# Altium project Mega2560_Custom_v2.0.PrjPcb (part 1 of 4)
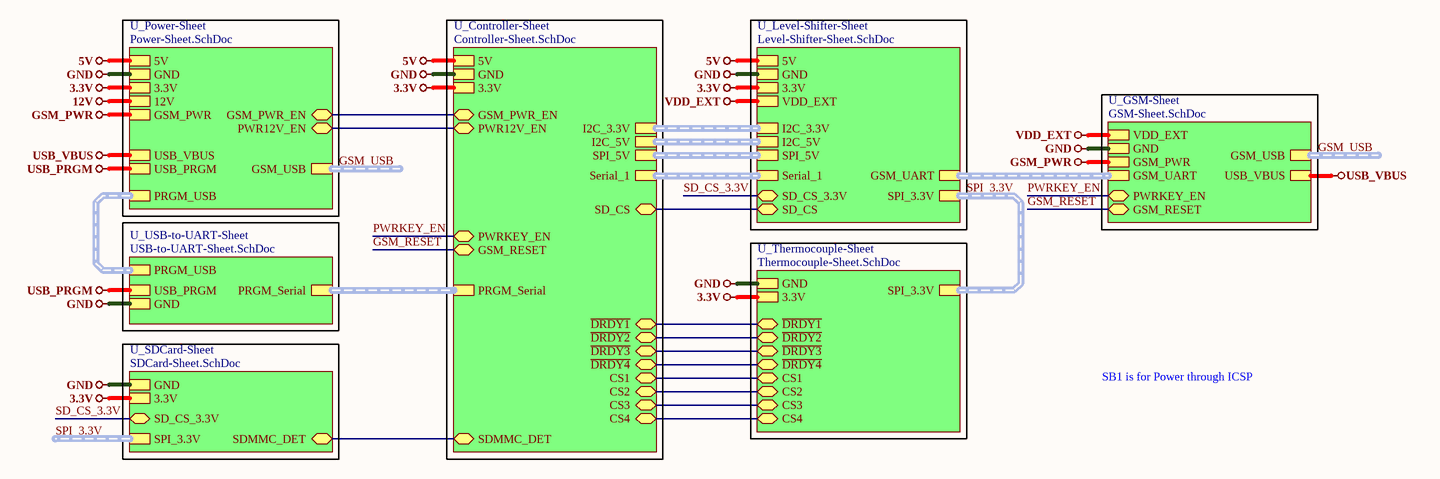
[diagram p0: Top-Sheet.SchDoc]
8 sheets, 213 parts. Net scope: hierarchical (ports join the sheet entries above them; power ports are global).
Board file: Mega2560_Custom.PcbDoc
Sheets:
  Top-Sheet.SchDoc
    U_Power-Sheet = Power-Sheet.SchDoc
    U_Thermocouple-Sheet = Thermocouple-Sheet.SchDoc
    U_Level-Shifter-Sheet = Level-Shifter-Sheet.SchDoc
    U_GSM-Sheet = GSM-Sheet.SchDoc
    U_USB-to-UART-Sheet = USB-to-UART-Sheet.SchDoc
    U_SDCard-Sheet = SDCard-Sheet.SchDoc
    U_Controller-Sheet = Controller-Sheet.SchDoc

## Sheet Top-Sheet.SchDoc
size A4; DocumentNumber: 1; SheetNumber: 1; SheetTotal: 8

### Sub-sheets
U_Controller-Sheet = Controller-Sheet.SchDoc: I2C_3.3V (harness I2C_3.3V), I2C_5V (harness I2C_5V), SPI_5V (harness SPI_5V), PRGM_Serial (harness PRGM_Serial), Serial_1 (harness Serial_1), ~{DRDY1} (bidir), ~{DRDY2} (bidir), ~{DRDY3} (bidir), ~{DRDY4} (bidir), CS1 (bidir), CS2 (bidir), CS3 (bidir), CS4 (bidir), PWRKEY_EN (bidir), GSM_RESET (bidir), SDMMC_DET (bidir), SD_CS (bidir), GSM_PWR_EN (bidir), PWR12V_EN (bidir), 5V, GND, 3.3V
U_GSM-Sheet = GSM-Sheet.SchDoc: GSM_UART (harness GSM_UART), GND, GSM_PWR, VDD_EXT, GSM_USB (harness GSM_USB), PWRKEY_EN (bidir), GSM_RESET (bidir), USB_VBUS
U_Level-Shifter-Sheet = Level-Shifter-Sheet.SchDoc: SPI_3.3V (harness SPI_3.3V), 5V, GND, 3.3V, VDD_EXT, I2C_3.3V (harness I2C_3.3V), I2C_5V (harness I2C_5V), SPI_5V (harness SPI_5V), Serial_1 (harness Serial_1), GSM_UART (harness GSM_UART), SD_CS_3.3V (bidir), SD_CS (bidir)
U_Power-Sheet = Power-Sheet.SchDoc: 5V, GND, 3.3V, 12V, GSM_USB (harness GSM_USB), PRGM_USB (harness PRGM_USB), GSM_PWR_EN (bidir), PWR12V_EN (bidir), GSM_PWR, USB_PRGM, USB_VBUS
U_SDCard-Sheet = SDCard-Sheet.SchDoc: SPI_3.3V (harness SPI_3.3V), GND, 3.3V, SD_CS_3.3V (bidir), SDMMC_DET (bidir)
U_Thermocouple-Sheet = Thermocouple-Sheet.SchDoc: GND, 3.3V, SPI_3.3V (harness Harness), ~{DRDY1} (bidir), ~{DRDY2} (bidir), ~{DRDY3} (bidir), ~{DRDY4} (bidir), CS1 (bidir), CS2 (bidir), CS3 (bidir), CS4 (bidir)
U_USB-to-UART-Sheet = USB-to-UART-Sheet.SchDoc: GND, USB_PRGM, PRGM_USB (harness PRGM_USB), PRGM_Serial (harness PRGM_Serial)

### Nets
3.3V: sheet U_Power-Sheet/3.3V, sheet U_Thermocouple-Sheet/3.3V, sheet U_Level-Shifter-Sheet/3.3V, sheet U_SDCard-Sheet/3.3V, sheet U_Controller-Sheet/3.3V
5V: sheet U_Power-Sheet/5V, sheet U_Level-Shifter-Sheet/5V, sheet U_Controller-Sheet/5V
GND: sheet U_Power-Sheet/GND, sheet U_Thermocouple-Sheet/GND, sheet U_Level-Shifter-Sheet/GND, sheet U_GSM-Sheet/GND, sheet U_USB-to-UART-Sheet/GND, sheet U_SDCard-Sheet/GND, sheet U_Controller-Sheet/GND
GSM_PWR: sheet U_Power-Sheet/GSM_PWR, sheet U_GSM-Sheet/GSM_PWR
USB_PRGM: sheet U_Power-Sheet/USB_PRGM, sheet U_USB-to-UART-Sheet/USB_PRGM
USB_VBUS: sheet U_Power-Sheet/USB_VBUS, sheet U_GSM-Sheet/USB_VBUS
VDD_EXT: sheet U_Level-Shifter-Sheet/VDD_EXT, sheet U_GSM-Sheet/VDD_EXT
CS1: sheet U_Thermocouple-Sheet/CS1, sheet U_Controller-Sheet/CS1
CS2: sheet U_Thermocouple-Sheet/CS2, sheet U_Controller-Sheet/CS2
CS3: sheet U_Thermocouple-Sheet/CS3, sheet U_Controller-Sheet/CS3
CS4: sheet U_Thermocouple-Sheet/CS4, sheet U_Controller-Sheet/CS4
~{DRDY1}: sheet U_Thermocouple-Sheet/~{DRDY1}, sheet U_Controller-Sheet/~{DRDY1}
~{DRDY2}: sheet U_Thermocouple-Sheet/~{DRDY2}, sheet U_Controller-Sheet/~{DRDY2}
~{DRDY3}: sheet U_Thermocouple-Sheet/~{DRDY3}, sheet U_Controller-Sheet/~{DRDY3}
~{DRDY4}: sheet U_Thermocouple-Sheet/~{DRDY4}, sheet U_Controller-Sheet/~{DRDY4}
GSM_PWR_EN: sheet U_Power-Sheet/GSM_PWR_EN, sheet U_Controller-Sheet/GSM_PWR_EN
GSM_RESET: sheet U_GSM-Sheet/GSM_RESET, sheet U_Controller-Sheet/GSM_RESET
PWR12V_EN: sheet U_Power-Sheet/PWR12V_EN, sheet U_Controller-Sheet/PWR12V_EN
PWRKEY_EN: sheet U_GSM-Sheet/PWRKEY_EN, sheet U_Controller-Sheet/PWRKEY_EN
SD_CS: sheet U_Level-Shifter-Sheet/SD_CS, sheet U_Controller-Sheet/SD_CS
SD_CS_3.3V: sheet U_Level-Shifter-Sheet/SD_CS_3.3V, sheet U_SDCard-Sheet/SD_CS_3.3V
SDMMC_DET: sheet U_SDCard-Sheet/SDMMC_DET, sheet U_Controller-Sheet/SDMMC_DET

### Buses and harness runs
harness GSM_USB = sheet U_GSM-Sheet/GSM_USB
harness GSM_USB = sheet U_Power-Sheet/GSM_USB
harness sheet U_Controller-Sheet/I2C_3.3V = sheet U_Level-Shifter-Sheet/I2C_3.3V
harness sheet U_Controller-Sheet/I2C_5V = sheet U_Level-Shifter-Sheet/I2C_5V
harness sheet U_Controller-Sheet/PRGM_Serial = sheet U_USB-to-UART-Sheet/PRGM_Serial
harness sheet U_Controller-Sheet/Serial_1 = sheet U_Level-Shifter-Sheet/Serial_1
harness sheet U_Controller-Sheet/SPI_5V = sheet U_Level-Shifter-Sheet/SPI_5V
harness sheet U_GSM-Sheet/GSM_UART = sheet U_Level-Shifter-Sheet/GSM_UART
harness sheet U_Power-Sheet/PRGM_USB = sheet U_USB-to-UART-Sheet/PRGM_USB
harness SPI_3.3V = sheet U_Level-Shifter-Sheet/SPI_3.3V = sheet U_Thermocouple-Sheet/SPI_3.3V
harness SPI_3.3V = sheet U_SDCard-Sheet/SPI_3.3V

### Notes on the sheet
- SB1 is for Power through ICSP
- File:
- Title:
- Date:
- Page
- Num:
- Total:
- Drawn By: Huzaifa Ali

## Sheet Power-Sheet.SchDoc
size A4; DocumentNumber: 2; SheetNumber: 2; SheetTotal: 8
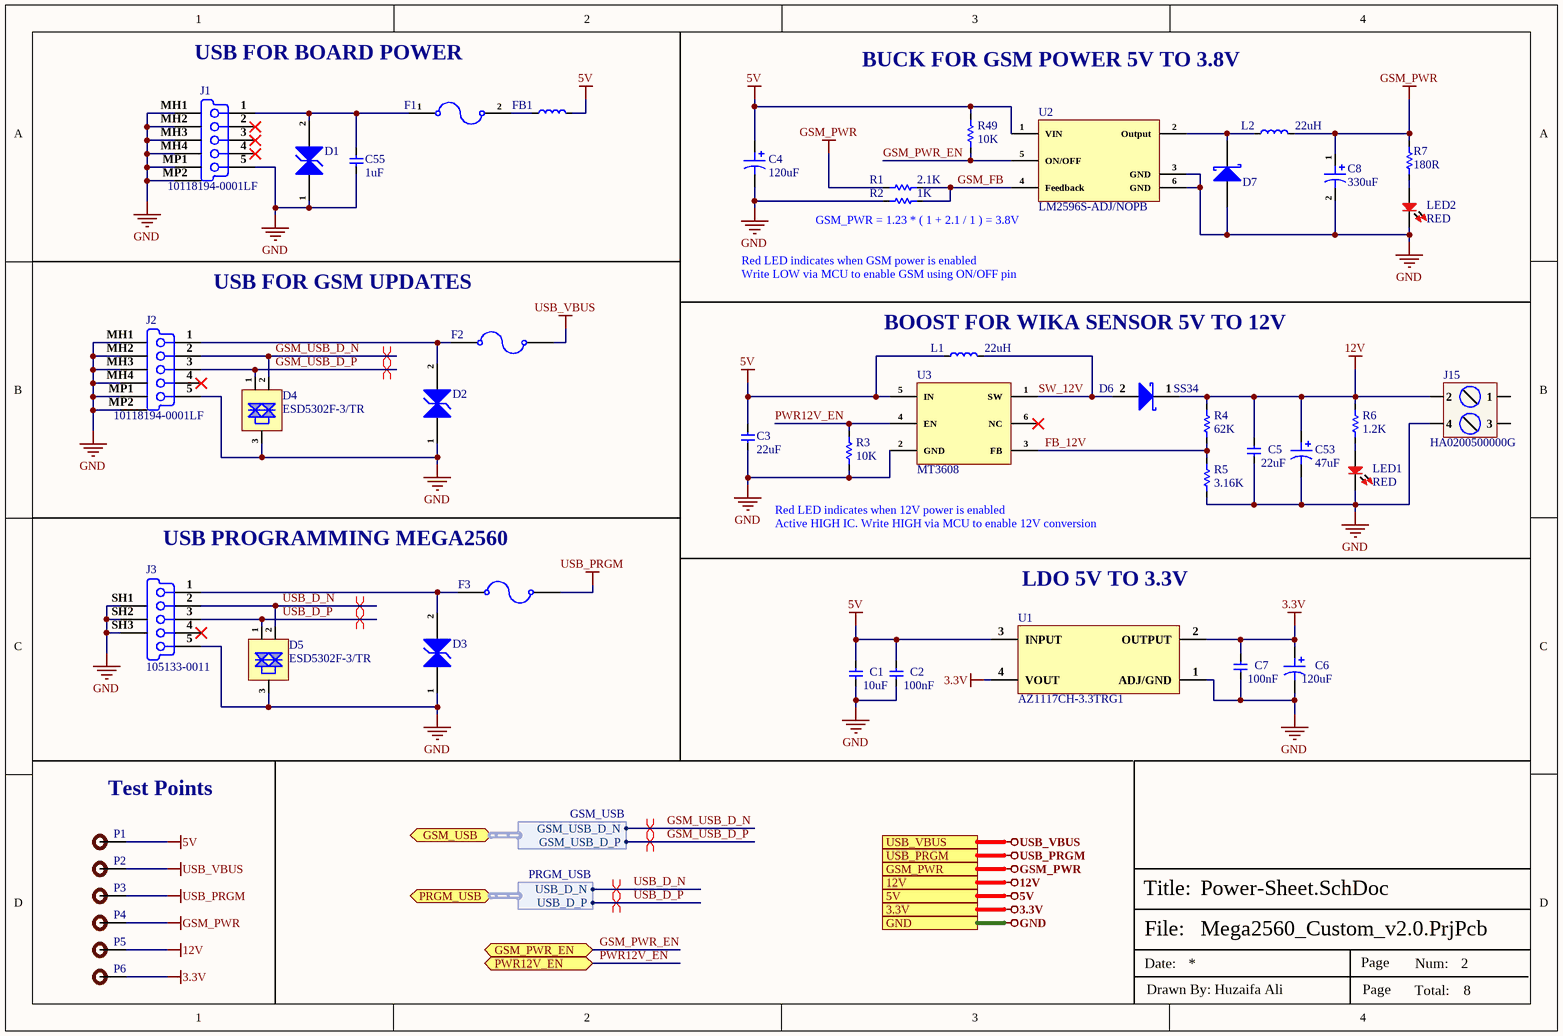
[diagram p1: Power-Sheet.SchDoc]

### Parts
C1  10uF  [Cap-0603]
C2  100nF  [Cap-0603]
C3  22uF  [Cap-0805]
C4  120uF  [20SVPF120M]
C5  22uF  [Cap-0805]
C6  120uF  [20SVPF120M]
C7  100nF  [Cap-0603]
C8  330uF  [Case-D]
C53  47uF  [25SVPF47M]
C55  1uF  [Cap-0603]
D1  PESD5V0H1BSFYL  [DSN0603-2]  (value not drawn)
D2  PESD5V0H1BSFYL  [DSN0603-2]  (value not drawn)
D3  PESD5V0H1BSFYL  [DSN0603-2]  (value not drawn)
D4  ESD5302F-3/TR  [Sot-23]
D5  ESD5302F-3/TR  [Sot-23]
D6  SS34  [SMA]
D7  SS32 /SMA(DO-214AC)  [SMA]  (value not drawn)
F1  1206L300SLTHYR  [Fuse 1206 (3216 Metric)]  (value not drawn)
F2  SMD0603-050  [Fuse-0603]  (value not drawn)
F3  SMD0603-050  [Fuse-0603]  (value not drawn)
FB1  100MHz  [IND-1206]  (value not drawn)
J1  10118194-0001LF  [10118194-0001LF_]
J2  10118194-0001LF  [10118194-0001LF_]
J3  105133-0011  [1051330011]
J15  HA0200500000G  [HA0200500000G]
L1  22uH  [SMRH74-220MT]
L2  22uH  [SSL0804T-220M-N]
LED1  RED  [LED-0603]
LED2  RED  [LED-0603]
P1  TEST POINT  [Test-point]  (value not drawn)
P2  TEST POINT  [Test-point]  (value not drawn)
P3  TEST POINT  [Test-point]  (value not drawn)
P4  TEST POINT  [Test-point]  (value not drawn)
P5  TEST POINT  [Test-point]  (value not drawn)
P6  TEST POINT  [Test-point]  (value not drawn)
R1  2.1K  [Res-0603]
R2  1K  [Res-0603]
R3  10K  [Res-0603]
R4  62K  [Res-0603]
R5  3.16K  [Res-0603]
R6  1.2K  [Res-0603]
R7  180R  [Res-0603]
R49  10K  [Res-0603]
U1  AZ1117CH-3.3TRG1  [SOT- 223]
U2  LM2596S-ADJ/NOPB  [DDPAK]
U3  MT3608  [SOT-23-6]

### Ports
3.3V, 5V, 12V, GND, GSM_PWR, GSM_PWR_EN (bidir), GSM_USB (bidir, harness GSM_USB), PRGM_USB (bidir, harness PRGM_USB), PWR12V_EN (bidir), USB_PRGM, USB_VBUS

### Harnesses
GSM_USB: GSM_USB_D_N, GSM_USB_D_P
PRGM_USB: USB_D_N, USB_D_P

### Nets
3.3V: C6.1 C7.2 P6.1 U1.2(OUTPUT) U1.4(VOUT) ; port 3.3V
5V: C1.2 C2.2 C3.2 C4.1 FB1.2 L1.1 P1.1 R49.2 U1.3(INPUT) U2.1(VIN) U3.5(IN) ; port 5V
12V: C5.2 C53.1 D6.1(K) J15.2 P5.1 R4.2 R6.2 ; port 12V
GND: C1.1 C2.1 C3.1 C4.2 C5.1 C6.2 C7.1 C8.2 C53.2 C55.1 D1.1 D2.1 D3.1 D4.3(GND) D5.3(GND) D7.2(A) J1.5(GND) J1.MH1(Tab) J1.MH2(Tab) J1.MH3(Tab) J1.MH4(Tab) J1.MP1(Tab) J1.MP2(Tab) J2.5(GND) J2.MH1(Tab) J2.MH2(Tab) J2.MH3(Tab) J2.MH4(Tab) J2.MP1(Tab) J2.MP2(Tab) J3.5(GND) J3.SH1 J3.SH2 J3.SH3 J15.4 LED1.2 LED2.2 R2.1 R3.1 R5.1 U1.1(ADJ/GND) U2.3(GND) U2.6(GND) U3.2(GND) ; port GND
GSM_PWR: C8.1 L2.2 P4.1 R1.1 R7.2 ; port GSM_PWR
USB_PRGM: F3.2 P3.1 ; port USB_PRGM
USB_VBUS: F2.2 P2.1 ; port USB_VBUS
FB_12V: R4.1 R5.2 U3.3(FB)
GSM_FB: R1.2 R2.2 U2.4(Feedback)
GSM_PWR_EN: R49.1 U2.5(ON/OFF) ; port GSM_PWR_EN
GSM_USB_D_N: D4.2(I/O2) J2.2(D-) ; port GSM_USB.GSM_USB_D_N  [project net GSM_USB.GSM_USB_D_N]
GSM_USB_D_P: D4.1(I/O1) J2.3(D+) ; port GSM_USB.GSM_USB_D_P  [project net GSM_USB.GSM_USB_D_P]
PWR12V_EN: R3.2 U3.4(EN) ; port PWR12V_EN
SW_12V: D6.2(A) L1.2 U3.1(SW)
USB_D_N: D5.2(I/O2) J3.2(D-) ; port PRGM_USB.USB_D_N
USB_D_P: D5.1(I/O1) J3.3(D+) ; port PRGM_USB.USB_D_P
NetC55_2: C55.2 D1.2 F1.1 J1.1(V_BUS_(5V))
NetD2_2: D2.2 F2.1 J2.1(V_BUS_(5V))
NetD3_2: D3.2 F3.1 J3.1(V_BUS_(5V))
NetD7_1: D7.1(K) L2.1 U2.2(Output)
NetF1_2: F1.2 FB1.1
NetLED1_1: LED1.1 R6.1
NetLED2_1: LED2.1 R7.1

Not connected (* = marked no-connect by the designer): J1 2(D-)* 3(D+)* 4(NC)*; J2 4(NC)*; J3 4(ID)*; J15 1 3; U3 6(NC)*

### Layout directives
differential pair: USB_D_N, USB_D_P
differential pair; net class USB; differential pair class USB_Lines; rule Impedance Constraint [Min = 85.00    Max = 90.00    ]; rule Matched Net Lengths [Tolerance = 50mil]: USB_D_N, USB_D_P
differential pair; net class GSM_USB; differential pair class GSM_USB_Lines; rule Impedance Constraint [Min = 85.00    Max = 90.00    ]; rule Matched Net Lengths [Tolerance = 50mil]: GSM_USB.GSM_USB_D_N, GSM_USB.GSM_USB_D_P

### Notes on the sheet
- USB FOR BOARD POWER
- BUCK FOR GSM POWER 5V TO 3.8V
- (near R2) GSM_PWR = 1.23 * ( 1 + 2.1 / 1 ) = 3.8V
- USB FOR GSM UPDATES
- Red LED indicates when GSM power is enabled
- Write LOW via MCU to enable GSM using ON/OFF pin
- (near L1) BOOST FOR WIKA SENSOR 5V TO 12V
- Red LED indicates when 12V power is enabled
- USB PROGRAMMING MEGA2560
- Active HIGH IC. Write HIGH via MCU to enable 12V conversion
- (near U1) LDO 5V TO 3.3V
- (near P1) Test Points
- File:
- Title:
- Date:
- Page
- Num:
- Total:
- Drawn By: Huzaifa Ali

### Library data of the parts
C1 = CC0603KRX5R7BB106: CAP CER 10UF 16V X5R 0603; Manufacturer: Yageo; Tolerance: 10%; Item Type: Capacitor; Supplier 1: Digi-Key; Manufacturer Part Number: CC0603KRX5R7BB106; RoHS: Yes; Category: Ceramic Capacitors; Stock 1: 240725; Pricing 1: 1=0.68000, 10=0.48000, 50=0.36300, 100=0.31610, 500=0.23416, 1000=0.19903 (USD); Mount: Surface Mount; Case/Package: 0603; Case Code (Imperial): 0603; Case Code (Metric): 1608; Min Operating Temperature: -55°C; Max Operating Temperature: 85°C; Packaging: Cut Tape; Capacitance: 10uF; Voltage Rating: 16V; RoHS Compliant: Yes; ComponentLink1URL: http://www.yageo.com/documents/recent/UPY-GPHC_X5R_4V-to-50V_25.pdf?src-supplier=Digi-Key; ComponentLink1Description: http://www.yageo.com/documents/recent/UPY-GPHC_X5R_4V-to-50V_25.pdf?src-supplier=Digi-Key; Supplier Part Number 1: 311-3486-1-ND; LCSC Part Number: C2936601
C2 C7 = CC0603KRX5R9BB104: CAP CER 0.1UF 50V X5R 0603; Manufacturer: Yageo; Tolerance: 10%; Item Type: Capacitor; Supplier 1: Digi-Key; Manufacturer Part Number: CC0603KRX5R9BB104; RoHS: Yes; Category: Ceramic Capacitors; Stock 1: 152253; Pricing 1: 1=0.10000, 10=0.05200, 50=0.02820, 100=0.02310, 500=0.01648, 1000=0.01294 (USD); Mount: Surface Mount; Case/Package: 0603; Case Code (Imperial): 0603; Case Code (Metric): 1608; Weight: 7.1E-05oz; Min Operating Temperature: -55°C; Max Operating Temperature: 85°C; Capacitance: 100nF; Packaging: Tape and Reel; Voltage Rating: 50V; Dielectric: X5R; Termination: SMD/SMT; Voltage Rating (DC): 50V; Package Quantity: 4000; Length: 0.063inch; Width: 0.031inch; Thickness: 0.035inch; Lead Free: Lead Free; Halogen Free: Halogen Free; ComponentLink1URL: http://www.mouser.com/ds/2/447/Yageo_UPY-GP_NP0_16V-to-50V_9-358835.pdf?src-supplier=Mouser; ComponentLink1Description: http://www.mouser.com/ds/2/447/Yageo_UPY-GP_NP0_16V-to-50V_9-358835.pdf?src-supplier=Mouser; ComponentLink2URL: https://www.yageo.com/upload/media/product/productsearch/datasheet/mlcc/UPY-GPHC_X5R_4V-to-50V_26.pdf?src-supplier=Digi-Key; ComponentLink2Description: https://www.yageo.com/upload/media/product/productsearch/datasheet/mlcc/UPY-GPHC_X5R_4V-to-50V_26.pdf?src-supplier=Digi-Key; ComponentLink3URL: http://www.yageo.com/exep/pages/download/literatures/ProductSelectionGuide%202014_Final_2.pdf?src-supplier=Digi-Key; ComponentLink3Description: http://www.yageo.com/exep/pages/download/literatures/ProductSelectionGuide%202014_Final_2.pdf?src-supplier=Digi-Key; Supplier Part Number 1: 311-4046-1-ND; LCSC Part Number: C110022
C3 C5 = CS2012X5R226M250NRE: 25V 22uF X5R ±20% 0805 Multilayer Ceramic Capacitors MLCC - SMD/SMT ROHS; Manufacturer: Samwha; Manufacturer Part Number: CS2012X5R226M250NRE; Package: 0805; LCSC Part Number: C513764; Item Type: Capacitor; ComponentLink1Description: LCSC; ComponentLink1URL: https://www.lcsc.com/product-detail/Multilayer-Ceramic-Capacitors-MLCC-SMD-SMT_Samwha-span-style-background-color-ff0-Capacitor-span-CS2012X5R226M250NRE_C513764.html
C4 C6 = 20SVPF120M: CAP ALUM POLY 120UF 20% 20V SMD; Manufacturer: Panasonic; Material: Polymer; ESR (Equivalent Series Resistance): 25mR; Ripple Current: 3.2A; Leakage Current: 480uA; Polarity: Polar; Life (Hours): 5000Hour; Dissipation Factor: 12%; Item Type: Capacitor; Supplier 1: Digi-Key; Manufacturer Part Number: 20SVPF120M; RoHS: Yes; Category: Aluminum Electrolytic Capacitors; Stock 1: 50150; Pricing 1: 1=1.45000, 10=1.14300, 50=0.99020, 100=0.85700, 500=0.64748 (USD); Mount: Surface Mount; Case/Package: Radial; Number of Pins: 6; Min Operating Temperature: -55°C; Max Operating Temperature: 105°C; Capacitance: 120uF; Tolerance: 20%; Voltage Rating: 20V; Packaging: Tape and Reel; Voltage Rating (DC): 20V; Package Quantity: 1000; Ripple Current (AC): 3.2A; Termination: SMD/SMT; Voltage: 20V; Series: OS-CON™, SVPF; Construction: Cylindrical; Diameter: 6.3mm; Length: 5.9mm; Height: 5.9mm; Height - Seated (Max): 0.236inch; Radiation Hardening: No; Reach SVHC Compliant: Yes; Lead Free: Lead Free; RoHS Compliant: Yes; ComponentLink1URL: https://datasheet.ciiva.com/24432/svpf-series-datasheet-24432811.pdf?src-supplier=Onlinecomponents.com; ComponentLink1Description: https://datasheet.ciiva.com/24432/svpf-series-datasheet-24432811.pdf?src-supplier=Onlinecomponents.com; ComponentLink2URL: https://datasheet.ciiva.com/25746/1734360-25746680.pdf?src-supplier=Farnell; ComponentLink2Description: https://datasheet.ciiva.com/25746/1734360-25746680.pdf?src-supplier=Farnell; ComponentLink3URL: https://datasheet.ciiva.com/22746/1734360-22746206.pdf?src-supplier=Element14; ComponentLink3Description: https://datasheet.ciiva.com/22746/1734360-22746206.pdf?src-supplier=Element14; ComponentLink4URL: https://datasheet.ciiva.com/46650/70324301-46650876.pdf?src-supplier=Allied+Electronics; ComponentLink4Description: https://datasheet.ciiva.com/46650/70324301-46650876.pdf?src-supplier=Allied+Electronics; Supplier Part Number 1: P16498CT-ND; LCSC Part Number: C186713
C8 = 6TPB330ML: CAP TANT POLY 330UF 6.3V 2917; Manufacturer: Panasonic; Tolerance: 20%; Leakage Current: 207.9uA; Polarity: Polar; ESR (Equivalent Series Resistance): 40mR; Ripple Current: 2A; Dissipation Factor: 10%; Item Type: Capacitor; Supplier 1: Arrow Electronics; Manufacturer Part Number: 6TPB330ML; RoHS: Yes; Category: Polymer Capacitors; Stock 1: 6258; Pricing 1: 1=2.17610, 10=1.72910, 25=1.72430, 100=1.31060, 250=1.29750, 500=0.96850, 1000=0.83640, 3000=0.77310, 6000=0.74930 (USD); Mount: Surface Mount; Case/Package: 2917; Case Code (Metric): 7343; Case Code (Imperial): 2917; Min Operating Temperature: -55°C; Max Operating Temperature: 105°C; Package Quantity: 2500; Packaging: Tape and Reel; Capacitance: 330uF; Voltage Rating: 6.3V; Voltage Rating (DC): 6.3V; Termination: SMD/SMT; Voltage: 6.3V; Features: General Purpose; Series: POSCAP™ TPB; Construction: Flat; Length: 7.3mm; Width: 4.3mm; Height: 2.8mm; Height - Seated (Max): 0.118inch; Depth: 4.3mm; Radiation Hardening: No; Reach SVHC Compliant: Yes; Lead Free: Lead Free; RoHS Compliant: Yes; ComponentLink1URL: https://datasheet.ciiva.com/48675/aaa8000ce6-48675081.pdf?src-supplier=Avnet; ComponentLink1Description: https://datasheet.ciiva.com/48675/aaa8000ce6-48675081.pdf?src-supplier=Avnet; ComponentLink2URL: https://datasheet.ciiva.com/22745/1734361-22745320.pdf?src-supplier=Element14; ComponentLink2Description: https://datasheet.ciiva.com/22745/1734361-22745320.pdf?src-supplier=Element14; ComponentLink3URL: https://datasheet.ciiva.com/25785/1734361-25785833.pdf?src-supplier=Farnell; ComponentLink3Description: https://datasheet.ciiva.com/25785/1734361-25785833.pdf?src-supplier=Farnell; Supplier Part Number 1: 6TPB330ML; LCSC Part Number: C236293
C53 = 25SVPF47M: CAP ALUM POLY 47UF 20% 25V SMD; Manufacturer: Panasonic; Dielectric Material: Aluminium; Polarity: Polarized; ESR (Equivalent Series Resistance): 30mR; Leakage Current: 235uA; Ripple Current: 140mA; Tan Delta: 0.12; Item Type: Capacitor; Supplier 1: Avnet; Manufacturer Part Number: 25SVPF47M; RoHS: Yes; Category: Polymer Capacitors; Stock 1: 1000; Pricing 1: 1000=0.43572, 2000=0.42658, 4000=0.41744, 6000=0.40830, 8000=0.39916 (USD); Mounting Technology: Surface Mount; Pins: 2; Package Shape: Cylindrical; Case/Package: 2626; Min Operating Temperature: -55°C; Max Operating Temperature: 105°C; Value: 47uF; Capacitor Type: Aluminium; Tolerance  (fill in as +-): 20%; Package Style: SMTMeter; Packaging: Tape and Reel; Tolerance (fill in as +-): 20%; Rated DC Voltage (URdc): 25V; Termination: Flat; Length: 7.3mm; Width: 6.6mm; Height: 5.9mm; Reach SVHC Compliant: Yes; RoHS Compliant: Yes; ComponentLink1URL: https://datasheet.ciiva.com:443/pdfs/VipMasterIC/IC/PANA/PANA-S-A0008969958/PANA-S-A0008969958-1.pdf?src-supplier=IHS+Markit; ComponentLink1Description: https://datasheet.ciiva.com:443/pdfs/VipMasterIC/IC/PANA/PANA-S-A0008969958/PANA-S-A0008969958-1.pdf?src-supplier=IHS+Markit; ComponentLink2URL: https://datasheet.ciiva.com/48542/svpf-eng-ds-48542390.pdf?src-supplier=Distrelec; ComponentLink2Description: https://datasheet.ciiva.com/48542/svpf-eng-ds-48542390.pdf?src-supplier=Distrelec; ComponentLink3URL: https://datasheet.ciiva.com/25746/1734360-25746558.pdf?src-supplier=Farnell; ComponentLink3Description: https://datasheet.ciiva.com/25746/1734360-25746558.pdf?src-supplier=Farnell; ComponentLink4URL: https://datasheet.ciiva.com/22746/1734360-22746218.pdf?src-supplier=Element14; ComponentLink4Description: https://datasheet.ciiva.com/22746/1734360-22746218.pdf?src-supplier=Element14; ComponentLink5URL: https://datasheet.ciiva.com/24025/svpf-os-262415-24025725.pdf?src-supplier=Mouser; ComponentLink5Description: https://datasheet.ciiva.com/24025/svpf-os-262415-24025725.pdf?src-supplier=Mouser; Supplier Part Number 1: 25SVPF47M; LCSC Part Number: C136280
C55 = CC0603KRX5R8BB105: CAP CER 1UF 25V X5R 0603; Manufacturer: Yageo; Tolerance: 10%; Item Type: Capacitor; Supplier 1: Digi-Key; Manufacturer Part Number: CC0603KRX5R8BB105; RoHS: Yes; Category: Ceramic Capacitors; Stock 1: 919939; Pricing 1: 1=0.12000, 10=0.08400, 50=0.04760, 100=0.03940, 500=0.02764, 1000=0.02288 (USD); Mount: Surface Mount; Case/Package: 0603; Number of Pins: 2; Case Code (Metric): 1608; Case Code (Imperial): 0603; Min Operating Temperature: -55°C; Max Operating Temperature: 85°C; Capacitance: 1uF; Dielectric: X5R; Package Quantity: 1; Voltage Rating: 25V; Packaging: Tape and Reel; Termination: SMD/SMT; Voltage Rating (DC): 25V; Series: CC; Construction: Flat; Length: 1.6mm; Width: 0.031inch; Height: 0.8mm; Thickness: 0.035inch; Depth: 0.8mm; Radiation Hardening: No; REACH SVHC: No SVHC; Lead Free: Lead Free; Halogen Free: Halogen Free; RoHS Compliant: Yes; ComponentLink1URL: https://datasheet.ciiva.com/176/mlccorderingcode-176785.pdf?src-supplier=Digi-Key; ComponentLink1Description: https://datasheet.ciiva.com/176/mlccorderingcode-176785.pdf?src-supplier=Digi-Key; ComponentLink2URL: https://datasheet.ciiva.com/176/mlccorderingcode-176786.pdf?src-supplier=Digi-Key; ComponentLink2Description: https://datasheet.ciiva.com/176/mlccorderingcode-176786.pdf?src-supplier=Digi-Key; ComponentLink3URL: https://datasheet.ciiva.com/176/mlccorderingcode-176787.pdf?src-supplier=Digi-Key; ComponentLink3Description: https://datasheet.ciiva.com/176/mlccorderingcode-176787.pdf?src-supplier=Digi-Key; ComponentLink4URL: https://datasheet.ciiva.com/17436/upy-gphc-x5r-4v-to-50v-12-17436952.pdf?src-supplier=Avnet+Europe; ComponentLink4Description: https://datasheet.ciiva.com/17436/upy-gphc-x5r-4v-to-50v-12-17436952.pdf?src-supplier=Avnet+Europe; ComponentLink5URL: https://datasheet.ciiva.com/7978/1525783-7978171.pdf?src-supplier=Element14; ComponentLink5Description: https://datasheet.ciiva.com/7978/1525783-7978171.pdf?src-supplier=Element14; ComponentLink6URL: https://datasheet.ciiva.com/11586/upy-gphc-x5r-4v-to-50v-12-11586318.pdf?src-supplier=Avnet; ComponentLink6Description: https://datasheet.ciiva.com/11586/upy-gphc-x5r-4v-to-50v-12-11586318.pdf?src-supplier=Avnet; Supplier Part Number 1: 311-1445-1-ND; LCSC Part Number: C14664
D1-D3 = PESD5V0H1BSFYL: TVS DIODE 5VWM 6.3VC DSN0603-2; Manufacturer: Nexperia; Supplier 1: Avnet; Manufacturer Part Number: PESD5V0H1BSFYL; RoHS: Yes; Category: ESD and Circuit Protection ICs; Stock 1: 9000; Pricing 1: 18000=0.06453, 36000=0.06278, 54000=0.06104, 90000=0.05930, 180000=0.05755, 900000=0.05581, 1800000=0.05406 (USD); RoHS Compliant: Yes; ComponentLink1URL: http://www.farnell.com/datasheets/1961312.pdf?src-supplier=Farnell; ComponentLink1Description: http://www.farnell.com/datasheets/1961312.pdf?src-supplier=Farnell; ComponentLink2URL: https://assets.nexperia.com/documents/data-sheet/PESD5V0H1BSF.pdf?src-supplier=Digi-Key; ComponentLink2Description: https://assets.nexperia.com/documents/data-sheet/PESD5V0H1BSF.pdf?src-supplier=Digi-Key; ComponentLink3URL: http://www.farnell.com/datasheets/1961312.pdf?src-supplier=Newark; ComponentLink3Description: http://www.farnell.com/datasheets/1961312.pdf?src-supplier=Newark; Supplier Part Number 1: PESD5V0H1BSFYL; LCSC Part Number: C477989; Item Type: Diode
D4 D5 = ESD5302F-3/TR: 16A 20V 7V 5V@Max Unidirectional SOT-23 TVS ROHS; Manufacturer: WILLSEMI; Item Type: Diode; Manufacturer Part Number: ESD5302F-3/TR; Package: SOT-23; LCSC Part Number: C239643; ComponentLink1Description: LCSC; ComponentLink1URL: https://www.lcsc.com/product-detail/TVS_WILLSEMI-Will-Semicon-ESD5302F-3-TR_C239643.html
D6 = SS34: 0.5mA@40V 40V Single 3A 0.55V@3A SMA(DO-214AC) Schottky Barrier Diodes (SBD) ROHS; Manufacturer: MDD; Item Type: Diode; Manufacturer Part Number: SS34; Package: SMA(DO-214AC); LCSC Part Number: C8678; ComponentLink1Description: LCSC; ComponentLink1URL: https://www.lcsc.com/product-detail/Schottky-Barrier-Diodes-SBD_MDD-Microdiode-Electronics-SS34_C8678.html
D7 = SS32 /SMA(DO-214AC): 20V 500mV@3A 3A SMA(DO-214AC) Schottky Barrier Diodes (SBD) ROHS; Manufacturer: MDD; Item Type: Diode; Manufacturer Part Number: SS32; Package: SMA(DO-214AC); LCSC Part Number: C34897; ComponentLink1Description: LCSC; ComponentLink1URL: https://www.lcsc.com/product-detail/Schottky-Barrier-Diodes-SBD_MDD-Microdiode-Electronics-SS32_C34897.html
F1 = 1206L300SLTHYR: PTC RESET FUSE 6V 3A 1206; Manufacturer: Littelfuse; Max Current Rating: 50A; Resistance: 20mR; Power Dissipation: 800mW; Trip Current: 6A; Time to Trip: 4s; Approvals: UL,TUV; Supplier 1: Arrow Electronics; Manufacturer Part Number: 1206L300SLTHYR; RoHS: Yes; Category: PTC Resettable Fuses; Stock 1: 4000; Pricing 1: 4000=0.60290 (USD); Case/Package: 1206; Case Code (Metric): 3216; Case Code (Imperial): 1206; Min Operating Temperature: -40°C; Max Operating Temperature: 85°C; Package Quantity: 4000; Packaging: Tape and Reel; Termination: SMD/SMT; Max Voltage Rating (DC): 6V; Hold Current: 3A; Voltage Rating (DC): 6V; Operating Supply Voltage: 6V; Series: POLY-FUSE®, LoRho™; Lead Free: Lead Free; RoHS Compliant: Yes; ComponentLink1URL: https://datasheet.ciiva.com/7438/littelfuse-lorho-ptc-7438567.pdf?src-supplier=Digi-Key; ComponentLink1Description: https://datasheet.ciiva.com/7438/littelfuse-lorho-ptc-7438567.pdf?src-supplier=Digi-Key; ComponentLink2URL: https://datasheet.ciiva.com/7438/littelfuse-lorho-ptc-7438569.pdf?src-supplier=Digi-Key; ComponentLink2Description: https://datasheet.ciiva.com/7438/littelfuse-lorho-ptc-7438569.pdf?src-supplier=Digi-Key; ComponentLink3URL: https://datasheet.ciiva.com/7438/littelfuse-lorho-ptc-7438565.pdf?src-supplier=Digi-Key; ComponentLink3Description: https://datasheet.ciiva.com/7438/littelfuse-lorho-ptc-7438565.pdf?src-supplier=Digi-Key; Supplier Part Number 1: 1206L300SLTHYR; LCSC Part Number: C207041; Item Type: Fuse
F2 F3 = SMD0603-050: 6V 500mA 40A 1A 0603 Resettable Fuses ROHS; Manufacturer: TECHFUSE; Supplier 1: LCSC; Manufacturer Part Number: SMD0603-050; RoHS: No; Category: Uncategorized; Supplier Part Number 1: C69679
FB1 = BLM31PG121SN1L: FERRITE BEAD 120 OHM 1206 1LN; Manufacturer: Murata; Material: Steel,Ferrite; Tolerance: 25%; Impedance: 120R; Max Current Rating: 3.5A; Number of Lines: 1; DC Resistance (DCR): 20mR; Max DC Current: 3A; Shielding: Unshielded; Supplier 1: Avnet; Manufacturer Part Number: BLM31PG121SN1L; RoHS: Yes; Category: Ferrite Beads and Chips; Stock 1: 290640; Pricing 1: 3000=0.11563, 6000=0.10938, 12000=0.10313, 18000=0.09688, 24000=0.09063, 30000=0.08438, 300000=0.07813 (USD); Case/Package: 1206; Number of Pins: 2; Core Material: Ferrite; Case Code (Metric): 3216; Case Code (Imperial): 1206; Contact Plating: Tin,Matte; Min Operating Temperature: -55°C; Max Operating Temperature: 125°C; Package Quantity: 3000; Packaging: Tape and Reel; Current Rating: 3.5A; Termination: SMD/SMT; Test Frequency: 100MHz; DC Current: 3A; Frequency: 100MHz; Length: 3.2mm; Width: 1.6mm; Height: 1.1mm; Depth: 1.6mm; Radiation Hardening: No; Military Standard: Not; Lead Free: Lead Free; RoHS Compliant: Yes; ComponentLink1URL: https://datasheet.ciiva.com/19460/1845419-19460234.pdf?src-supplier=Jameco; ComponentLink1Description: https://datasheet.ciiva.com/19460/1845419-19460234.pdf?src-supplier=Jameco; ComponentLink2URL: https://datasheet.ciiva.com/1012/l0132s0193blm31p-1012992.pdf?src-supplier=Digi-Key; ComponentLink2Description: https://datasheet.ciiva.com/1012/l0132s0193blm31p-1012992.pdf?src-supplier=Digi-Key; ComponentLink3URL: https://datasheet.ciiva.com/11799/0900766b811b5866-11799444.pdf?src-supplier=RSComponents; ComponentLink3Description: https://datasheet.ciiva.com/11799/0900766b811b5866-11799444.pdf?src-supplier=RSComponents; ComponentLink4URL: https://datasheet.ciiva.com/3081/l0110s0100blm31p-3081665.pdf?src-supplier=Avnet; ComponentLink4Description: https://datasheet.ciiva.com/3081/l0110s0100blm31p-3081665.pdf?src-supplier=Avnet; ComponentLink5URL: https://datasheet.ciiva.com/41449/001172383-da-01-en-drossel-1206-120r-3-2x1-60mm-3000st-41449554.pdf?src-supplier=Conrad; ComponentLink5Description: https://datasheet.ciiva.com/41449/001172383-da-01-en-drossel-1206-120r-3-2x1-60mm-3000st-41449554.pdf?src-supplier=Conrad; ComponentLink6URL: https://datasheet.ciiva.com/29348/442557-da-01-en-chip-drossel-1206-120r-3000ma-3-2x1-60mm-29348014.pdf?src-supplier=Conrad; ComponentLink6Description: https://datasheet.ciiva.com/29348/442557-da-01-en-chip-drossel-1206-120r-3000ma-3-2x1-60mm-29348014.pdf?src-supplier=Conrad; ComponentLink7URL: https://datasheet.ciiva.com/14122/apblm31p-data-e-14122856.pdf?src-supplier=Distrelec; ComponentLink7Description: https://datasheet.ciiva.com/14122/apblm31p-data-e-14122856.pdf?src-supplier=Distrelec; ComponentLink8URL: https://datasheet.ciiva.com/48436/blm31pg121sn1l-eng-tds-48436731.pdf?src-supplier=Distrelec; ComponentLink8Description: https://datasheet.ciiva.com/48436/blm31pg121sn1l-eng-tds-48436731.pdf?src-supplier=Distrelec; ComponentLink9URL: https://datasheet.ciiva.com/1012/l0110s0100blm31p-1012991.pdf?src-supplier=Digi-Key; ComponentLink9Description: https://datasheet.ciiva.com/1012/l0110s0100blm31p-1012991.pdf?src-supplier=Digi-Key; ComponentLink10URL: https://datasheet.ciiva.com/1012/l0110s0100blm31p-1012993.pdf?src-supplier=Digi-Key; ComponentLink10Description: https://datasheet.ciiva.com/1012/l0110s0100blm31p-1012993.pdf?src-supplier=Digi-Key; ComponentLink11URL: https://datasheet.ciiva.com/3081/l0110s0100blm31p-3081666.pdf?src-supplier=Avnet; ComponentLink11Description: https://datasheet.ciiva.com/3081/l0110s0100blm31p-3081666.pdf?src-supplier=Avnet; ComponentLink12URL: https://datasheet.ciiva.com/16390/l0110s0100blm31p-16390857.pdf?src-supplier=Future+Electronics; ComponentLink12Description: https://datasheet.ciiva.com/16390/l0110s0100blm31p-16390857.pdf?src-supplier=Future+Electronics; ComponentLink13URL: https://datasheet.ciiva.com/18093/getdatasheetpartid-152966-18093084.pdf?src-supplier=Verical; ComponentLink13Description: https://datasheet.ciiva.com/18093/getdatasheetpartid-152966-18093084.pdf?src-supplier=Verical; Supplier Part Number 1: BLM31PG121SN1L; LCSC Part Number: C85841; Item Type: Ferrite Bead
J1 J2 = 10118194-0001LF: CONN RCPT USB2.0 MICRO B SMD R/A; Manufacturer: Amphenol FCI; Gender: Receptacle; Current Rating: 1.8A; Connector Type: USB,Receptacle; Number of Contacts: 5; Insulation Resistance: 1GR; Number of Ports: 1; Max Voltage Rating (AC): 100V; Pitch: 0.65mm; Item Type: USB Connector; Supplier 1: Digi-Key; Manufacturer Part Number: 10118194-0001LF; Stock 1: 35943; Pricing 1: 1=0.43, 10=0.405, 25=0.3648, 50=0.3242, 100=0.3107, 250=0.28368, 500=0.27016 (USD); Mount: Surface Mount,Horizontal; Color: Black; Contact Material: Copper Alloy; Contact Plating: Gold; Number of Terminals: 5; Housing Material: Polymer; Min Operating Temperature: -55°C; Max Operating Temperature: 85°C; Package Quantity: 9600; Packaging: Tape and Reel; Termination: Solder; Orientation: Right Angle; Features: Shielded; Length: 8.05mm; Depth: 5mm; Radiation Hardening: No; Lead Free: Lead Free; Flammability Rating: UL94 V-0; ComponentLink1URL: http://www.amphenol-icc.com/media/wysiwyg/files/drawing/10118194.pdf?src-supplier=Digi-Key; ComponentLink1Description: http://www.amphenol-icc.com/media/wysiwyg/files/drawing/10118194.pdf?src-supplier=Digi-Key; ComponentLink2URL: https://cdn.amphenol-icc.com/media/wysiwyg/files/drawing/10118194.pdf?src-supplier=Mouser; ComponentLink2Description: https://cdn.amphenol-icc.com/media/wysiwyg/files/drawing/10118194.pdf?src-supplier=Mouser; ComponentLink3URL: https://cdn.amphenol-icc.com/media/wysiwyg/files/drawing/10118194.pdf?src-supplier=Verical; ComponentLink3Description: https://cdn.amphenol-icc.com/media/wysiwyg/files/drawing/10118194.pdf?src-supplier=Verical; Supplier Part Number 1: 609-4618-1-ND; LCSC Part Number: C132563
J3 = 105133-0011: CONN RCPT USB2.0 MICRO B SMD; Manufacturer: Molex; Connector Type: TELECOM AND DATACOM CONNECTOR; Option: General Purpose; Contact Resistance: 30mR; Contact Style: USB; Dielectric Withstanding Voltage (AC): 140V; Durability: 10000Cycles; Empty Shell: No; Insulation Resistance: 1GR; Number Of Connectors: 1; PCB Contact Pattern: RECTANGULAR; Polarization Key: POLARIZED HOUSING; Rated Current (Signal): 1A; Number of Contacts: 5; Body Breadth: 0.118inch; Body Depth: 0.264inch; Body Length: 0.315inch; Mounting Option 1: LOCKING; Reference Standard: UL; Reliability: COMMERCIAL; Item Type: USB Connector; Supplier 1: Avnet; Manufacturer Part Number: 105133-0011; RoHS: Yes; Category: USB Connectors; Stock 1: 12800; Pricing 1: 500=1.01170 (USD); Mounting Technology: Board; Contact Material: Copper Alloy; Contact Finish - Mating: NOT SPECIFIED; Contact Finish - Termination: Gold (Au) - with Nickel (Ni) barrier; Insulation Material: Polyethylene; Shell Finish: Tin; Shell Material: Stainless Steel; Min Operating Temperature: -30°C; Max Operating Temperature: 85°C; JESD-609 Code: e4; Contact Gender: Female; Filter Feature: No; Mixed Contacts: No; Mounting Style: STRAIGHT; Number Of PCB Rows: 1; Termination: SMD/SMT; Terminal Pitch: 0.6604mm; Flammability Rating: UL94 V-0; Reach SVHC Compliant: Yes; RoHS Compliant: Yes; DIN Conformance: No; IEC Conformance: No; MIL Conformance: No; ComponentLink1URL: https://datasheet.ciiva.com:443/pdfs/VipMasterIC/IC/MOLE/MOLE-S-A0000025294/MOLE-S-A0000025294-1.pdf?src-supplier=IHS+Markit; ComponentLink1Description: https://datasheet.ciiva.com:443/pdfs/VipMasterIC/IC/MOLE/MOLE-S-A0000025294/MOLE-S-A0000025294-1.pdf?src-supplier=IHS+Markit; ComponentLink2URL: https://datasheet.ciiva.com/29660/1051330011-sd-29660273.pdf?src-supplier=Digi-Key; ComponentLink2Description: https://datasheet.ciiva.com/29660/1051330011-sd-29660273.pdf?src-supplier=Digi-Key; ComponentLink3URL: https://datasheet.ciiva.com/15181/getdatasheetpartid-719072-15181485.pdf?src-supplier=Verical; ComponentLink3Description: https://datasheet.ciiva.com/15181/getdatasheetpartid-719072-15181485.pdf?src-supplier=Verical; Supplier Part Number 1: 105133-0011; LCSC Part Number: C586226
J15 = HA0200500000G: TERM BLK 2POS TOP ENT 5.08MM PCB; Manufacturer: Amphenol; Item Type: Terminal Block; Supplier 1: Arrow Electronics; Manufacturer Part Number: HA0200500000G; RoHS: Yes; Stock 1: 120; Pricing 1: 2160=0.34600, 2520=0.34400, 3600=0.29460, 9000=0.29270, 18000=0.29070, 45000=0.28890, 90000=0.28680 (USD); Terminal and Terminal Block Type: BARRIER STRIP TERMINAL BLOCK; RoHS Compliant: Yes; Reach SVHC Compliant: Yes; ComponentLink1URL: https://datasheet.ciiva.com:443/pdfs/VipMasterIC/IC/AMPH/AMPH-S-A0005047712/AMPH-S-A0005047712-1.pdf?src-supplier=IHS+Markit; ComponentLink1Description: https://datasheet.ciiva.com:443/pdfs/VipMasterIC/IC/AMPH/AMPH-S-A0005047712/AMPH-S-A0005047712-1.pdf?src-supplier=IHS+Markit; Supplier Part Number 1: HA0200500000G; LCSC Part Number: C967080
L1 = SMRH74-220MT: 22uH ±20% SMD Power Inductors ROHS; Manufacturer: SXN(Shun Xiang Nuo Elec); Manufacturer Part Number: SMRH74-220MT; Package: Custom; LCSC Part Number: C27442; Item Type: Inductor; ComponentLink1Description: LCSC; ComponentLink1URL: https://www.lcsc.com/product-detail/Power-Inductors_SXN-Shun-Xiang-Nuo-Elec-SMRH74-220MT_C27442.html
L2 = SSL0804T-220M-N: 2.6A 22uH ±20% 0.085Ω 2.6A SMD,12.95x9.4x5.21mm Power Inductors ROHS; Manufacturer: Chilisin Elec; Manufacturer Part Number: SSL0804T-220M-N; Package: SMD,12.95x9.4x5.21mm; LCSC Part Number: C108312; Item Type: Inductor; ComponentLink1Description: LCSC; ComponentLink1URL: https://www.lcsc.com/product-detail/Power-Inductors_Chilisin-Elec-SSL0804T-220M-N_C108312.html
LED1 LED2 = 19-21/R7C-AK1L2BY/3T: Red 632nm LED Indication - Discrete 2.05V 0603 (1608 Metric); Manufacturer: Everlight Elec; Manufacturer Part Number: 19-21/R7C-AK1L2BY/3T; Package: 0603; LCSC Part Number: C1322287; Item Type: LED; ComponentLink1Description: LCSC; ComponentLink1URL: https://www.lcsc.com/product-detail/Light-Emitting-Diodes-LED_Everlight-Elec-19-21-R7C-AK1L2BY-3T_C1322287.html
P1-P6 = TEST POINT: Test Point ON
R1 = RT0603BRD072K1L: RES SMD 2.1K OHM 0.1% 1/10W 0603; Manufacturer: Yageo; Resistance: 2.1kR; Voltage Rating: 75V; Power Rating: 100mW; Temperature Coefficient: 25ppm/°C; Voltage Rating (DC): 50V; Item Type: Resistor; Supplier 1: Arrow Electronics; Manufacturer Part Number: RT0603BRD072K1L; RoHS: Yes; Category: Chip SMD Resistors; Stock 1: 4891; Pricing 1: 1=0.32000, 10=0.26320, 25=0.26040, 100=0.10310, 250=0.10280, 500=0.10180, 1000=0.06110, 3000=0.03900 (USD); Case/Package: 0603; Case Code (Imperial): 0603; Case Code (Metric): 1608; Min Operating Temperature: -55°C; Max Operating Temperature: 125°C; Tolerance: 0.1%; Packaging: Tape and Reel; Resistor Type: Thin Film; Number of Terminations: 2; Termination: SMD/SMT; Max Power Dissipation: 100mW; Features: Moisture Resistant; Series: RT; Construction: Rectangular; Length: 0.063inch; Width: 0.031inch; Height: 0.022inch; Depth: 0.8mm; Military Standard: Not; Lead Free: Lead Free; RoHS Compliant: Yes; ComponentLink1URL: https://datasheet.ciiva.com/12723/pyu-rt-1-to-0-05-rohs-l-4-12723880.pdf?src-supplier=Mouser; ComponentLink1Description: https://datasheet.ciiva.com/12723/pyu-rt-1-to-0-05-rohs-l-4-12723880.pdf?src-supplier=Mouser; Supplier Part Number 1: RT0603BRD072K1L; LCSC Part Number: C861293
R2 = RT0603BRD071KL: RES SMD 1K OHM 0.1% 1/10W 0603; Manufacturer: Yageo; Resistance: 1kR; Power Rating: 100mW; Voltage Rating: 75V; Temperature Coefficient: 25ppm/°C; Voltage Rating (DC): 50V; Item Type: Resistor; Supplier 1: Arrow Electronics; Manufacturer Part Number: RT0603BRD071KL; RoHS: Yes; Category: Chip SMD Resistors; Stock 1: 130000; Pricing 1: 5000=0.03900, 10000=0.03450, 25000=0.03070, 50000=0.02040 (USD); Mount: Surface Mount; Case/Package: 0603; Case Code (Metric): 1608; Case Code (Imperial): 0603; Contact Plating: Tin,Lead; Size Code: 0603; Min Operating Temperature: -55°C; Max Operating Temperature: 125°C; Package Quantity: 5000; Packaging: Tape and Reel; Resistor Type: Thin Film; Number of Terminations: 2; Termination: SMD/SMT; Max Power Dissipation: 100mW; Features: Moisture Resistant; Series: RT; Technology: THIN FILM; Construction: Rectangular; Length: 1.6mm; Width: 0.031inch; Height: 0.022inch; Depth: 0.8mm; Military Standard: Not; Lead Free: Lead Free; RoHS Compliant: Yes; ComponentLink1URL: https://datasheet.ciiva.com/11819/0900766b8079c86e-11819652.pdf?src-supplier=RSComponents; ComponentLink1Description: https://datasheet.ciiva.com/11819/0900766b8079c86e-11819652.pdf?src-supplier=RSComponents; ComponentLink2URL: https://datasheet.ciiva.com/5624/pyu-rt-1-to-0-05-rohs-l-4-5624759.pdf?src-supplier=Mouser; ComponentLink2Description: https://datasheet.ciiva.com/5624/pyu-rt-1-to-0-05-rohs-l-4-5624759.pdf?src-supplier=Mouser; ComponentLink3URL: https://datasheet.ciiva.com/29718/pyu-rt-1-to-0-05-rohs-l-4-29718010.pdf?src-supplier=Digi-Key; ComponentLink3Description: https://datasheet.ciiva.com/29718/pyu-rt-1-to-0-05-rohs-l-4-29718010.pdf?src-supplier=Digi-Key; ComponentLink4URL: https://datasheet.ciiva.com/29718/pyu-rt-1-to-0-05-rohs-l-4-29718011.pdf?src-supplier=Digi-Key; ComponentLink4Description: https://datasheet.ciiva.com/29718/pyu-rt-1-to-0-05-rohs-l-4-29718011.pdf?src-supplier=Digi-Key; Supplier Part Number 1: RT0603BRD071KL; LCSC Part Number: C110776
R3 R49 = RC0603FR-0710KL: RES SMD 10K Ohm 1% 1/10W 0603; Manufacturer: Yageo; Resistance: 10kR; Temperature Coefficient: 100ppm/°C; Voltage Rating (DC): 50V; Power Rating: 100mW; Voltage Rating: 75V; Item Type: Resistor; Supplier 1: Digi-Key; Manufacturer Part Number: RC0603FR-0710KL; RoHS: Yes; Category: Chip SMD Resistors; Stock 1: 25249139; Pricing 1: 1=0.10000, 10=0.02400, 100=0.00970, 1000=0.00436, 2500=0.00378 (USD); Case/Package: 0603; Number of Pins: 2; Case Code (Imperial): 0603; Case Code (Metric): 1608; Weight: 7.1E-05oz; Size Code: 0603; Min Operating Temperature: -55°C; Max Operating Temperature: 155°C; Tolerance: 1%; Resistor Type: Thick Film; Packaging: Tape and Reel; Termination: SMD/SMT; Features: Moisture Resistant; Series: RC; Max Power Dissipation: 100mW; Number of Terminations: 2; Resistance Tolerance: 1%; Construction: Rectangular; Length: 1.6mm; Width: 0.8mm; Height: 0.45mm; Depth: 0.8mm; Lead Pitch: 0.3mm; REACH SVHC: Unknown; Lead Free: Lead Free; Military Standard: Not; RoHS Compliant: Yes; ComponentLink1URL: https://datasheet.ciiva.com/7660/38590-7660789.pdf?src-supplier=Element14; ComponentLink1Description: https://datasheet.ciiva.com/7660/38590-7660789.pdf?src-supplier=Element14; ComponentLink2URL: https://datasheet.ciiva.com/7983/443971-7983596.pdf?src-supplier=Element14; ComponentLink2Description: https://datasheet.ciiva.com/7983/443971-7983596.pdf?src-supplier=Element14; ComponentLink3URL: https://datasheet.ciiva.com/22747/443971-22747519.pdf?src-supplier=Element14; ComponentLink3Description: https://datasheet.ciiva.com/22747/443971-22747519.pdf?src-supplier=Element14; ComponentLink4URL: https://datasheet.ciiva.com/46440/1868787-46440891.pdf?src-supplier=Element14; ComponentLink4Description: https://datasheet.ciiva.com/46440/1868787-46440891.pdf?src-supplier=Element14; ComponentLink5URL: https://datasheet.ciiva.com/7746/1738695-7746239.pdf?src-supplier=Element14; ComponentLink5Description: https://datasheet.ciiva.com/7746/1738695-7746239.pdf?src-supplier=Element14; ComponentLink6URL: https://datasheet.ciiva.com/15189/getdatasheetpartid-409289-15189591.pdf?src-supplier=Verical; ComponentLink6Description: https://datasheet.ciiva.com/15189/getdatasheetpartid-409289-15189591.pdf?src-supplier=Verical; Supplier Part Number 1: 311-10.0KHRCT-ND; LCSC Part Number: C98220
R4 = RT0603BRD0762KL: RES SMD 62K OHM 0.1% 1/10W 0603; Manufacturer: Yageo; Resistance: 62kR; Power Rating: 100mW; Voltage Rating: 75V; Temperature Coefficient: 25ppm/°C; Voltage Rating (DC): 50V; Item Type: Resistor; Supplier 1: Digi-Key; Manufacturer Part Number: RT0603BRD0762KL; RoHS: Yes; Category: Chip SMD Resistors; Stock 1: 20000; Pricing 1: 1=0.34000, 10=0.28800, 100=0.11260, 500=0.06812, 1000=0.04716, 2500=0.04322 (USD); Case/Package: 0603; Case Code (Imperial): 0603; Case Code (Metric): 1608; Weight: 7.1E-05oz; Contact Plating: Tin,Matte; Min Operating Temperature: -55°C; Max Operating Temperature: 125°C; Tolerance: 0.1%; Packaging: Tape and Reel; Package Quantity: 5000; Resistor Type: Thin Film; Termination: SMD/SMT; Number of Terminations: 2; Max Power Dissipation: 100mW; Features: Moisture Resistant; Series: RT; Construction: Rectangular; Length: 1.6mm; Width: 0.8mm; Height: 0.022inch; Depth: 0.8mm; Radiation Hardening: No; Military Standard: Not; Lead Free: Lead Free; RoHS Compliant: Yes; ComponentLink1URL: https://datasheet.ciiva.com/8888/pyu-rt-1-to-0-05-rohs-l-4-8888573.pdf?src-supplier=Avnet; ComponentLink1Description: https://datasheet.ciiva.com/8888/pyu-rt-1-to-0-05-rohs-l-4-8888573.pdf?src-supplier=Avnet; ComponentLink2URL: https://datasheet.ciiva.com/2586/pyu-rt-1-to-0-05-rohs-l-4-2586028.pdf?src-supplier=Digi-Key; ComponentLink2Description: https://datasheet.ciiva.com/2586/pyu-rt-1-to-0-05-rohs-l-4-2586028.pdf?src-supplier=Digi-Key; ComponentLink3URL: https://datasheet.ciiva.com/46635/pyu-rt-1-to-0-05-rohs-l-5-46635035.pdf?src-supplier=Digi-Key; ComponentLink3Description: https://datasheet.ciiva.com/46635/pyu-rt-1-to-0-05-rohs-l-5-46635035.pdf?src-supplier=Digi-Key; Supplier Part Number 1: YAG1707CT-ND; LCSC Part Number: C136961
R5 = RT0603BRD073K16L: RES SMD 3.16KOHM 0.1% 1/10W 0603; Manufacturer: Yageo; Voltage Rating: 75V; Resistance: 3.16kR; Power Rating: 100mW; Temperature Coefficient: 25ppm/°C; Voltage Rating (DC): 50V; Item Type: Resistor; Supplier 1: Arrow Electronics; Manufacturer Part Number: RT0603BRD073K16L; RoHS: Yes; Category: Chip SMD Resistors; Stock 1: 4487; Pricing 1: 1=0.31330, 10=0.25380, 25=0.25120, 100=0.09580, 250=0.09480, 500=0.09380, 1000=0.05630, 3000=0.03310 (USD); Case/Package: 0603; Case Code (Metric): 1608; Case Code (Imperial): 0603; Min Operating Temperature: -55°C; Max Operating Temperature: 125°C; Tolerance: 0.1%; Packaging: Tape and Reel; Package Quantity: 5000; Termination: SMD/SMT; Resistor Type: Thin Film; Number of Terminations: 2; Max Power Dissipation: 100mW; Series: RT; Construction: Rectangular; Length: 0.063inch; Width: 0.031inch; Height: 0.022inch; Depth: 0.8mm; Military Standard: Not; Lead Free: Lead Free; RoHS Compliant: Yes; ComponentLink1URL: https://datasheet.ciiva.com/2585/pyu-rt-1-to-0-05-rohs-l-5-2585923.pdf?src-supplier=Digi-Key; ComponentLink1Description: https://datasheet.ciiva.com/2585/pyu-rt-1-to-0-05-rohs-l-5-2585923.pdf?src-supplier=Digi-Key; Supplier Part Number 1: RT0603BRD073K16L; LCSC Part Number: C861373
R6 = RC0603FR-071K2L: RES SMD 1.2K OHM 1% 1/10W 0603; Manufacturer: Yageo; Power Rating: 100mW; Voltage Rating (DC): 50V; Resistance: 1.2kR; Temperature Coefficient: 100ppm/°C; Item Type: Resistor; Supplier 1: Digi-Key; Manufacturer Part Number: RC0603FR-071K2L; RoHS: Yes; Category: Chip SMD Resistors; Stock 1: 531140; Pricing 1: 1=0.10000, 10=0.02400, 100=0.00970, 1000=0.00436, 2500=0.00378 (USD); Case/Package: 0603; Number of Pins: 2; Case Code (Imperial): 0603; Case Code (Metric): 1608; Size Code: 0603; Min Operating Temperature: -55°C; Max Operating Temperature: 155°C; Tolerance: 1%; Packaging: Tape and Reel; Voltage Rating: 50V; Termination: SMD/SMT; Resistor Type: Thick Film; Features: Moisture Resistant; Series: RC; Max Power Dissipation: 100mW; Number of Terminations: 2; Construction: Rectangular; Resistance Tolerance: 1%; Length: 1.6mm; Width: 0.8mm; Height: 0.45mm; Depth: 0.8mm; REACH SVHC: No SVHC; Lead Free: Lead Free; Military Standard: Not; RoHS Compliant: Yes; Supplier Part Number 1: 311-1.20KHRCT-ND; LCSC Part Number: C114605
R7 = RC0603FR-07180RL: RES 180 OHM 1% 1/10W 0603; Manufacturer: Yageo; Power Rating: 100mW; Voltage Rating (DC): 50V; Temperature Coefficient: 100ppm/°C; Item Type: Resistor; Supplier 1: Avnet; Manufacturer Part Number: RC0603FR-07180RL; RoHS: Yes; Category: Chip SMD Resistors; Stock 1: 35000; Pricing 1: 5000=0.00133, 10000=0.00131, 20000=0.00127 (USD); Case/Package: 0603; Number of Pins: 2; Case Code (Metric): 1608; Case Code (Imperial): 0603; Size Code: 0603; Min Operating Temperature: -55°C; Max Operating Temperature: 155°C; Tolerance: 1%; Resistance: 180R; Packaging: Tape and Reel; Package Quantity: 1; Voltage Rating: 50V; Resistor Type: Thick Film; Number of Terminations: 2; Termination: SMD/SMT; Max Power Dissipation: 100mW; Features: Moisture Resistant; Series: RC; Construction: Rectangular; Resistance Tolerance: 1%; Length: 1.6mm; Width: 0.8mm; Height: 0.022inch; Depth: 0.8mm; Lead Free: Lead Free; Military Standard: Not; RoHS Compliant: Yes; ComponentLink1URL: https://datasheet.ciiva.com/2454/pyu-r-int-thick-7-2454469.pdf?src-supplier=Digi-Key; ComponentLink1Description: https://datasheet.ciiva.com/2454/pyu-r-int-thick-7-2454469.pdf?src-supplier=Digi-Key; ComponentLink2URL: https://datasheet.ciiva.com/2454/pyu-r-int-thick-7-2454470.pdf?src-supplier=Digi-Key; ComponentLink2Description: https://datasheet.ciiva.com/2454/pyu-r-int-thick-7-2454470.pdf?src-supplier=Digi-Key; ComponentLink3URL: https://datasheet.ciiva.com/2454/pyu-r-int-thick-7-2454468.pdf?src-supplier=Digi-Key; ComponentLink3Description: https://datasheet.ciiva.com/2454/pyu-r-int-thick-7-2454468.pdf?src-supplier=Digi-Key; ComponentLink4URL: https://datasheet.ciiva.com/7746/443971-7746267.pdf?src-supplier=Element14; ComponentLink4Description: https://datasheet.ciiva.com/7746/443971-7746267.pdf?src-supplier=Element14; ComponentLink5URL: https://datasheet.ciiva.com/7746/443971-7746266.pdf?src-supplier=Element14; ComponentLink5Description: https://datasheet.ciiva.com/7746/443971-7746266.pdf?src-supplier=Element14; ComponentLink6URL: https://datasheet.ciiva.com/15189/getdatasheetpartid-325160-15189622.pdf?src-supplier=Verical; ComponentLink6Description: https://datasheet.ciiva.com/15189/getdatasheetpartid-325160-15189622.pdf?src-supplier=Verical; Supplier Part Number 1: RC0603FR-07180RL; LCSC Part Number: C137786
U1 = AZ1117CH-3.3TRG1: 15V 1.3V @ 800mA Fixed 3.3V SOT-223 Linear Voltage Regulators (LDO) ROHS; Manufacturer: Diodes Incorporated; Item Type: IC; Manufacturer Part Number: AZ1117CH-3.3TRG1; Package: SOT-223; LCSC Part Number: C92102; ComponentLink1Description: LCSC; ComponentLink1URL: https://lcsc.com/product-detail/Linear-Voltage-Regulators-LDO_Diodes-Incorporated-AZ1117CH-3-3TRG1_C92102.html
U2 = LM2596S-ADJ/NOPB: IC REG BUCK ADJ 3A TO263-5; Manufacturer: TI National Semiconductor; Number of Outputs: 1; Output Voltage: 37V; Min Input Voltage: 4.5V; Max Input Voltage: 40V; Switching Frequency: 173kHz; Efficiency: 73%; Min Output Voltage: 1.2V; Quiescent Current: 5mA; Output Type: Adjustable; Supplier 1: Mouser; Manufacturer Part Number: LM2596S-ADJ/NOPB; RoHS: Yes; Category: Voltage Regulators - Switching; Pricing 1: 1=7.15000, 10=6.46000, 50=6.16000, 100=5.34000, 1000=5.10000, 10000=5.10000 (USD); Mount: Surface Mount; Case/Package: TO-263; Number of Pins: 5; Weight: 0.056128oz; Contact Plating: Tin,Matte; Min Operating Temperature: -40°C; Max Operating Temperature: 125°C; Max Output Current: 3A; Packaging: Rail/Tube; Output Current: 3A; Operating Supply Voltage: 40V; Series: LM2596; Max Output Voltage: 37V; Length: 10.16mm; Width: 8.64mm; Height: 4.57mm; Radiation Hardening: No; Lead Free: Contains Lead; Reach SVHC Compliant: Yes; RoHS Compliant: Yes; ComponentLink1URL: https://datasheet.ciiva.com/27056/2051160-27056491.pdf?src-supplier=Jameco; ComponentLink1Description: https://datasheet.ciiva.com/27056/2051160-27056491.pdf?src-supplier=Jameco; ComponentLink2URL: https://datasheet.ciiva.com/15112/getdatasheetpartid-55559-15112636.pdf?src-supplier=Verical; ComponentLink2Description: https://datasheet.ciiva.com/15112/getdatasheetpartid-55559-15112636.pdf?src-supplier=Verical; ComponentLink3URL: https://datasheet.ciiva.com/41457/001013814-da-01-en-ic-reg-buc-lm2596s-adj-nopb-to-263-5-tid-41457756.pdf?src-supplier=Conrad; ComponentLink3Description: https://datasheet.ciiva.com/41457/001013814-da-01-en-ic-reg-buc-lm2596s-adj-nopb-to-263-5-tid-41457756.pdf?src-supplier=Conrad; ComponentLink4URL: https://datasheet.ciiva.com/22669/1874590-22669464.pdf?src-supplier=Element14; ComponentLink4Description: https://datasheet.ciiva.com/22669/1874590-22669464.pdf?src-supplier=Element14; ComponentLink5URL: https://datasheet.ciiva.com/14150/jqlm2596x-xx-e-14150653.pdf?src-supplier=Distrelec; ComponentLink5Description: https://datasheet.ciiva.com/14150/jqlm2596x-xx-e-14150653.pdf?src-supplier=Distrelec; ComponentLink6URL: https://datasheet.ciiva.com/6596/lm2596-6596342.pdf?src-supplier=Digi-Key; ComponentLink6Description: https://datasheet.ciiva.com/6596/lm2596-6596342.pdf?src-supplier=Digi-Key; Supplier Part Number 1: 926-LM2596S-ADJ/NOPB; LCSC Part Number: C1355333; Item Type: IC
U3 = MT3608: boost converterType 1 Boost 28V 2V~24V 1.2MHz SOT-23-6 DC-DC Converters ROHS; Manufacturer: XI'AN Aerosemi Tech; Item Type: IC; Manufacturer Part Number: MT3608; Package: SOT-23-6; LCSC Part Number: C84817; ComponentLink1Description: LCSC; ComponentLink1URL: https://www.lcsc.com/product-detail/DC-DC-Converters_XI-AN-Aerosemi-Tech-MT3608_C84817.html